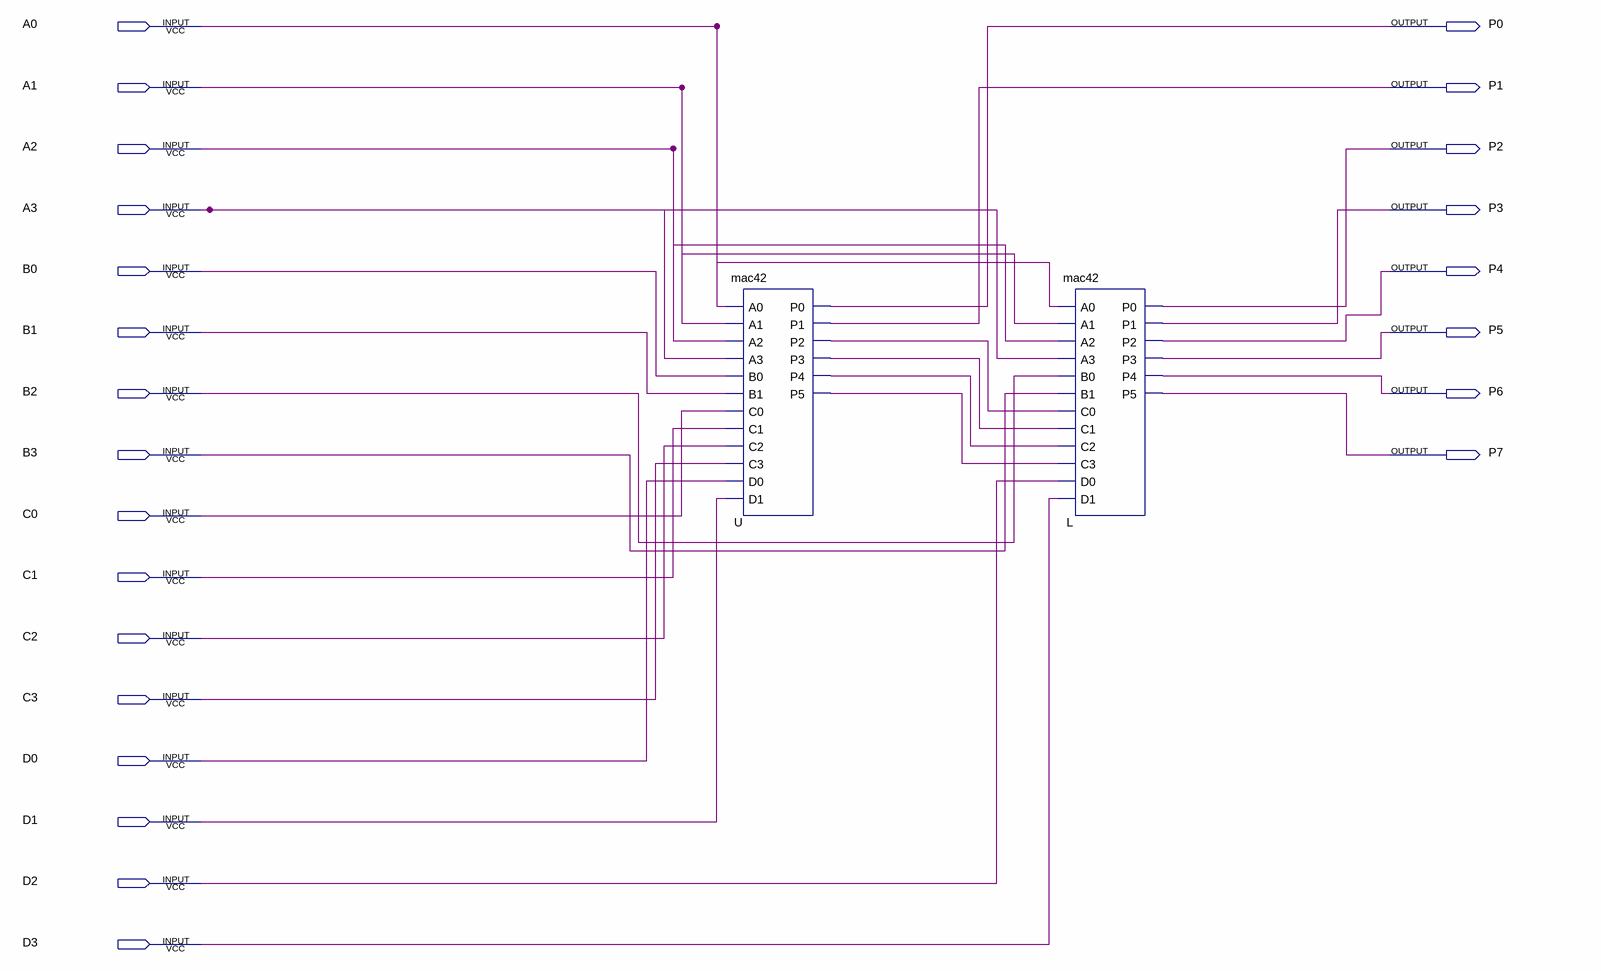
[diagram p0: schematic sheet]
// Quartus schematic mac44.bdf as structural Verilog: 2 symbols, 24 pins
module mac44 (
  input  A0,
  input  A1,
  input  A2,
  input  A3,
  input  B0,
  input  B1,
  input  B2,
  input  B3,
  input  C0,
  input  C1,
  input  C2,
  input  C3,
  input  D0,
  input  D1,
  input  D2,
  input  D3,
  output P0,
  output P1,
  output P2,
  output P3,
  output P4,
  output P5,
  output P6,
  output P7
);

  wire U_p2, U_p3, U_p4, U_p5;

  mac42 U (
    .A0(A0), .A1(A1), .A2(A2), .A3(A3), .B0(B0), .B1(B1), .C0(C0), .C1(C1), .C2(C2), .C3(C3), .D0(D0),
    .D1(D1), .P0(P0), .P1(P1), .P2(U_p2), .P3(U_p3), .P4(U_p4), .P5(U_p5));
  mac42 L (
    .A0(A0), .A1(A1), .A2(A2), .A3(A3), .B0(B2), .B1(B3), .C0(U_p2), .C1(U_p3), .C2(U_p4), .C3(U_p5),
    .D0(D2), .D1(D3), .P0(P2), .P1(P3), .P2(P4), .P3(P5), .P4(P6), .P5(P7));
endmodule
